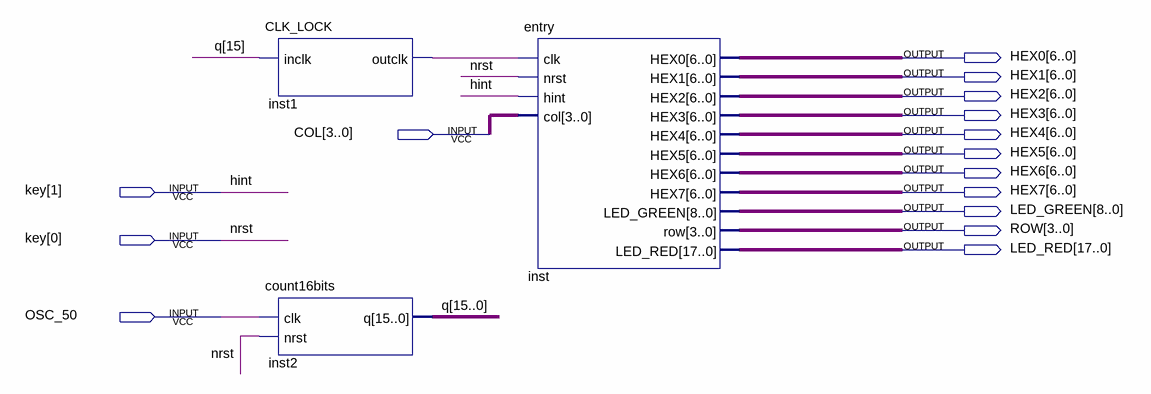
[diagram p0: schematic sheet]
// Quartus schematic lab2_fpga.bdf as structural Verilog: 3 symbols, 15 pins
module lab2_fpga (
  input  [3:0] COL,
  input  [1:0] key,
  input  OSC_50,
  output [6:0] HEX0,
  output [6:0] HEX1,
  output [6:0] HEX2,
  output [6:0] HEX3,
  output [6:0] HEX4,
  output [6:0] HEX5,
  output [6:0] HEX6,
  output [6:0] HEX7,
  output [8:0] LED_GREEN,
  output [3:0] ROW,
  output [17:0] LED_RED
);

  wire inst1_outclk;
  wire [15:0] q;

  CLK_LOCK inst1 (.inclk(q[15]), .outclk(inst1_outclk));
  count16bits inst2 (.clk(OSC_50), .nrst(key[0]), .q(q));
  entry inst (
    .clk(inst1_outclk), .nrst(key[0]), .hint(key[1]), .col(COL), .HEX0(HEX0), .HEX1(HEX1), .HEX2(HEX2),
    .HEX3(HEX3), .HEX4(HEX4), .HEX5(HEX5), .HEX6(HEX6), .HEX7(HEX7), .LED_GREEN(LED_GREEN), .row(ROW),
    .LED_RED(LED_RED));

  // Other names for the same wires on the sheet: hint = key[1]; nrst = key[0]
endmodule
